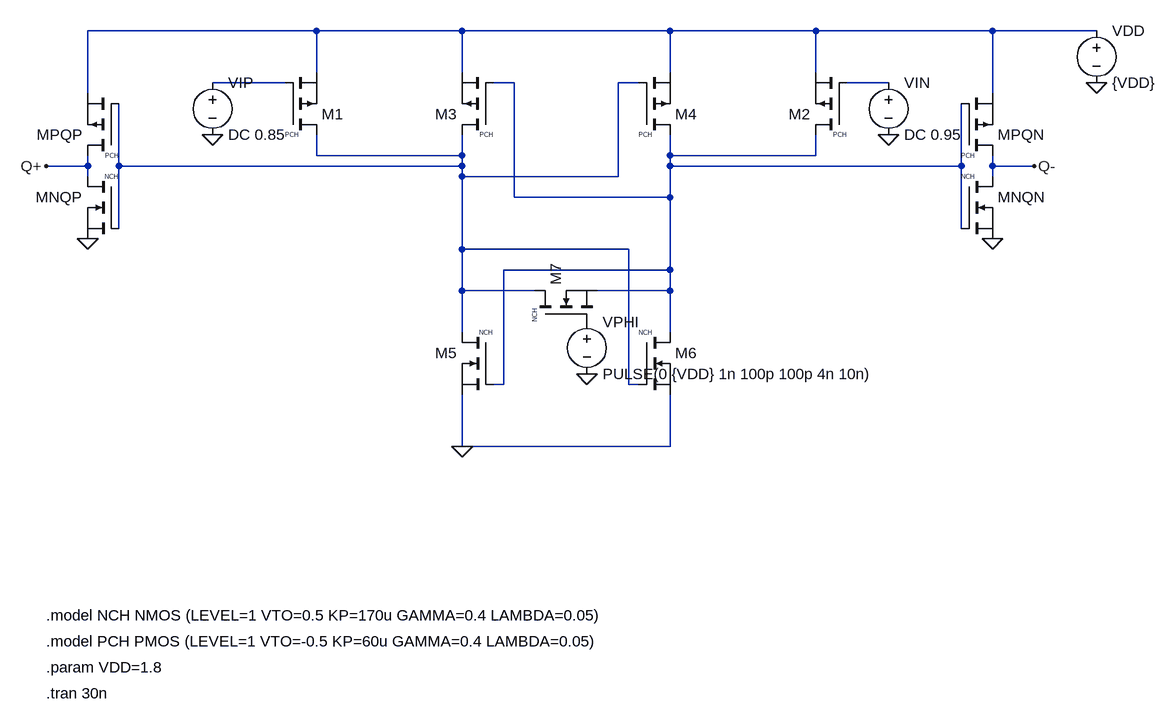
[diagram p0: schematic 1_static_latch.asc]
1_static_latch.asc, the LTspice schematic file:
Version 4
SHEET 1 3000 2000
WIRE -320 208 -256 208
WIRE -256 0 -256 96
WIRE -256 0 96 0
WIRE -256 192 -256 208
WIRE -256 208 -256 224
WIRE -208 112 -208 208
WIRE -208 208 -208 304
WIRE -208 208 320 208
WIRE -64 80 48 80
WIRE 96 0 96 64
WIRE 96 0 320 0
WIRE 96 160 96 192
WIRE 96 192 320 192
WIRE 320 0 320 64
WIRE 320 0 640 0
WIRE 320 160 320 192
WIRE 320 192 320 208
WIRE 320 208 320 224
WIRE 320 224 320 336
WIRE 320 224 560 224
WIRE 320 336 320 400
WIRE 320 336 576 336
WIRE 320 400 320 464
WIRE 320 400 432 400
WIRE 320 560 320 640
WIRE 320 640 640 640
WIRE 368 80 400 80
WIRE 368 544 384 544
WIRE 384 368 384 544
WIRE 384 368 640 368
WIRE 400 80 400 256
WIRE 400 256 640 256
WIRE 528 400 640 400
WIRE 560 80 560 224
WIRE 560 80 592 80
WIRE 576 336 576 544
WIRE 576 544 592 544
WIRE 640 0 640 64
WIRE 640 0 864 0
WIRE 640 160 640 192
WIRE 640 192 640 208
WIRE 640 192 864 192
WIRE 640 208 640 256
WIRE 640 208 1088 208
WIRE 640 256 640 368
WIRE 640 368 640 400
WIRE 640 400 640 464
WIRE 640 560 640 640
WIRE 864 0 864 64
WIRE 864 0 1136 0
WIRE 864 160 864 192
WIRE 912 80 976 80
WIRE 1088 112 1088 208
WIRE 1088 208 1088 304
WIRE 1136 0 1136 96
WIRE 1136 0 1296 0
WIRE 1136 192 1136 208
WIRE 1136 208 1136 224
WIRE 1136 208 1200 208
FLAG 1296 80 0
FLAG -64 160 0
FLAG 976 160 0
FLAG -256 320 0
FLAG -320 208 Q+
FLAG 1136 320 0
FLAG 1200 208 Q-
FLAG 512 528 0
FLAG 320 640 0
SYMBOL voltage 1296 -16 R0
SYMATTR InstName VDD
SYMATTR Value {VDD}
SYMBOL pmos 48 160 M180
WINDOW 3 0 0 Left 0
WINDOW 123 0 0 Left 0
SYMATTR InstName M1
SYMATTR Value PCH
SYMATTR SpiceLine l=0.18u w=4u
SYMBOL pmos 368 160 R180
WINDOW 3 0 0 Left 0
WINDOW 123 0 0 Left 0
SYMATTR InstName M3
SYMATTR Value PCH
SYMATTR SpiceLine l=0.18u w=4u
SYMBOL pmos 592 160 M180
WINDOW 3 0 0 Left 0
WINDOW 123 0 0 Left 0
SYMATTR InstName M4
SYMATTR Value PCH
SYMATTR SpiceLine l=0.18u w=4u
SYMBOL pmos 912 160 R180
WINDOW 3 0 0 Left 0
WINDOW 123 0 0 Left 0
SYMATTR InstName M2
SYMATTR Value PCH
SYMATTR SpiceLine l=0.18u w=4u
SYMBOL voltage -64 64 R0
SYMATTR InstName VIP
SYMATTR Value DC 0.85
SYMBOL voltage 976 64 R0
SYMATTR InstName VIN
SYMATTR Value DC 0.95
SYMBOL pmos -208 192 R180
WINDOW 3 0 0 Left 0
WINDOW 123 0 0 Left 0
SYMATTR InstName MPQP
SYMATTR Value PCH
SYMATTR SpiceLine l=0.18u w=4u
SYMBOL nmos -208 224 M0
WINDOW 3 0 0 Left 0
WINDOW 123 0 0 Left 0
SYMATTR InstName MNQP
SYMATTR Value NCH
SYMATTR SpiceLine l=0.18u w=2u
SYMBOL pmos 1088 192 M180
WINDOW 3 0 0 Left 0
WINDOW 123 0 0 Left 0
SYMATTR InstName MPQN
SYMATTR Value PCH
SYMATTR SpiceLine l=0.18u w=4u
SYMBOL nmos 1088 224 R0
WINDOW 3 0 0 Left 0
WINDOW 123 0 0 Left 0
SYMATTR InstName MNQN
SYMATTR Value NCH
SYMATTR SpiceLine l=0.18u w=2u
SYMBOL nmos 432 448 R270
WINDOW 3 0 0 Left 0
WINDOW 123 0 0 Left 0
SYMATTR InstName M7
SYMATTR Value NCH
SYMATTR SpiceLine l=0.18u w=2u
SYMBOL voltage 512 432 R0
SYMATTR InstName VPHI
SYMATTR Value PULSE(0 {VDD} 1n 100p 100p 4n 10n)
SYMBOL nmos 368 464 M0
WINDOW 3 0 0 Left 0
WINDOW 123 0 0 Left 0
SYMATTR InstName M5
SYMATTR Value NCH
SYMATTR SpiceLine l=0.18u w=2u
SYMBOL nmos 592 464 R0
WINDOW 3 0 0 Left 0
WINDOW 123 0 0 Left 0
SYMATTR InstName M6
SYMATTR Value NCH
SYMATTR SpiceLine l=0.18u w=2u
TEXT -320 900 Left 2 !.model NCH NMOS (LEVEL=1 VTO=0.5 KP=170u GAMMA=0.4 LAMBDA=0.05)
TEXT -320 940 Left 2 !.model PCH PMOS (LEVEL=1 VTO=-0.5 KP=60u GAMMA=0.4 LAMBDA=0.05)
TEXT -320 980 Left 2 !.param VDD=1.8
TEXT -320 1020 Left 2 !.tran 30n

The netlist it stands for:
* 1_static_latch.asc
VDD N001 0 {VDD}
M1 N002 N003 N001 N001 PCH l=0.18u w=4u
M3 N002 N004 N001 N001 PCH l=0.18u w=4u
M4 N004 N002 N001 N001 PCH l=0.18u w=4u
M2 N004 N005 N001 N001 PCH l=0.18u w=4u
VIP N003 0 DC 0.85
VIN N005 0 DC 0.95
MPQP Q+ N002 N001 N001 PCH l=0.18u w=4u
MNQP Q+ N002 0 0 NCH l=0.18u w=2u
MPQN Q- N004 N001 N001 PCH l=0.18u w=4u
MNQN Q- N004 0 0 NCH l=0.18u w=2u
M7 N002 P001 N004 N004 NCH l=0.18u w=2u
VPHI P001 0 PULSE(0 {VDD} 1n 100p 100p 4n 10n)
M5 N002 N004 0 0 NCH l=0.18u w=2u
M6 N004 N002 0 0 NCH l=0.18u w=2u
.model NMOS NMOS
.model PMOS PMOS
.lib standard.mos
.model NCH NMOS (LEVEL=1 VTO=0.5 KP=170u GAMMA=0.4 LAMBDA=0.05)
.model PCH PMOS (LEVEL=1 VTO=-0.5 KP=60u GAMMA=0.4 LAMBDA=0.05)
.param VDD=1.8
.tran 30n
.backanno
.end